# Altium project DT10965_MOTOR_CONTROLLER.PrjPcb (part 4 of 4)

## Sheet Power_management.SchDoc: =DT_SCH_Title
size A3; Organization: Droid Technologies; DocumentNumber: DT10965; Revision: 1.0
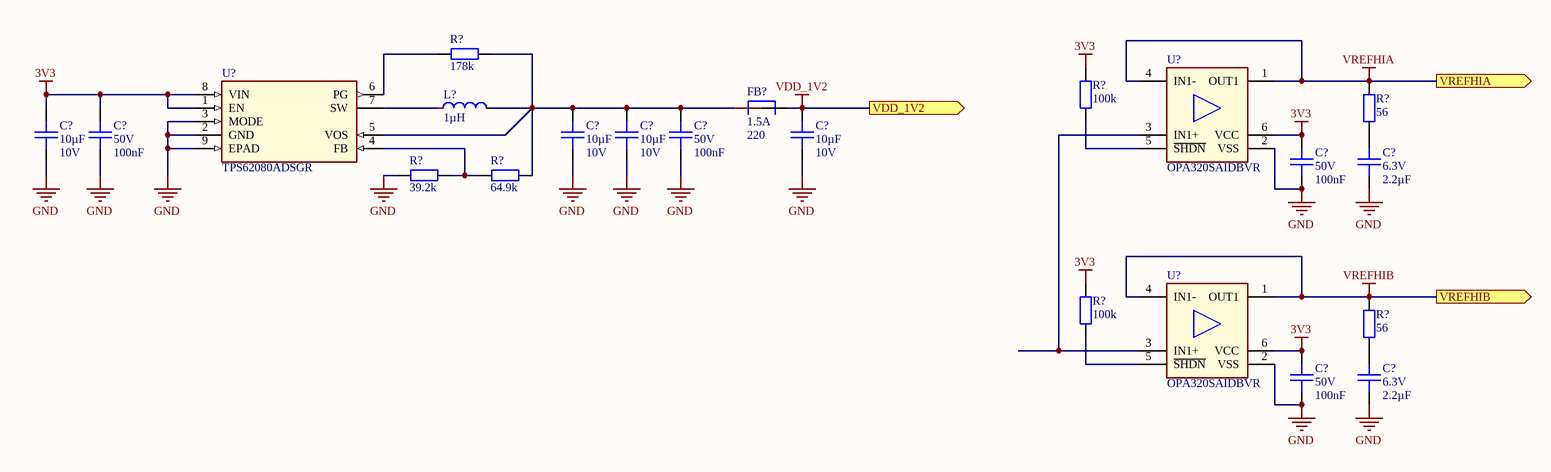
[diagram p12: Power_management.SchDoc]

### Parts
(Parts that share a designator on the sheet are numbered #1, #2 ... from top to bottom, then left to right.)
C?#156  Capacitance: 10µF  Voltage Rating: 10V  [CAPC200X125X145L50]  (hidden comment: CGA4J1X8L1A106K125AC)
C?#157  Voltage Rating: 50V  Capacitance: 100nF  [CAPC100x50x50L25]  (hidden comment: GCM155L8EH104KE07D)
C?#158  Capacitance: 10µF  Voltage Rating: 10V  [CAPC200X125X145L50]  (hidden comment: CGA4J1X8L1A106K125AC)
C?#159  Capacitance: 10µF  Voltage Rating: 10V  [CAPC200X125X145L50]  (hidden comment: CGA4J1X8L1A106K125AC)
C?#160  Voltage Rating: 50V  Capacitance: 100nF  [CAPC100x50x50L25]  (hidden comment: GCM155L8EH104KE07D)
C?#161  Capacitance: 10µF  Voltage Rating: 10V  [CAPC200X125X145L50]  (hidden comment: CGA4J1X8L1A106K125AC)
C?#162  Voltage Rating: 50V  Capacitance: 100nF  [CAPC100x50x50L25]  (hidden comment: GCM155L8EH104KE07D)
C?#163  Voltage Rating: 6.3V  Capacitance: 2.2µF  [CAPC160X80X90L35]  (hidden comment: C1608X8L0J225K080AC)
C?#164  Voltage Rating: 50V  Capacitance: 100nF  [CAPC100x50x50L25]  (hidden comment: GCM155L8EH104KE07D)
C?#165  Voltage Rating: 6.3V  Capacitance: 2.2µF  [CAPC160X80X90L35]  (hidden comment: C1608X8L0J225K080AC)
FB?#14  Imax: 1.5A  Impedance: 220  [BEADC160X80X95L40]  (hidden comment: BLM18KG221BH1D)
L?#2  Inductance: 1µH  [INDC250X200X120L60]  (hidden comment: DFE2HCAH1R0MJ0L)
R?#188  Resistance: 178k  [RESC100X50X40L25]  (hidden comment: RC0402FR-07178KL)
R?#189  Resistance: 100k  [RESC100X50X40L25]  (hidden comment: RC0402FR-07100KL)
R?#190  Resistance: 56  [RESC100X50X40L25]  (hidden comment: RC0402FR-0756RL)
R?#191  Resistance: 39.2k  [RESC100X50X40L25]  (hidden comment: RMCF0402FT39K2)
R?#192  Resistance: 64.9k  [RESC100X50X40L25]  (hidden comment: RC0402FR-0764K9L)
R?#193  Resistance: 100k  [RESC100X50X40L25]  (hidden comment: RC0402FR-07100KL)
R?#194  Resistance: 56  [RESC100X50X40L25]  (hidden comment: RC0402FR-0756RL)
U?#36  OPA320SAIDBVR  [SOT-23-6]
U?#37  TPS62080ADSGR  [WSON (8) 2*2mm]
U?#38  OPA320SAIDBVR  [SOT-23-6]

### Ports
VDD_1V2 (out), VREFHIA (out), VREFHIB (out)

### Nets
3V3: C?#156.2 C?#157.2 C?#162.2 C?#164.2 R?#189.2 R?#193.2 U?#36.6(VCC) U?#37.1(EN) U?#37.8(VIN) U?#38.6(VCC)
GND: C?#156.1 C?#157.1 C?#158.1 C?#159.1 C?#160.1 C?#161.1 C?#162.1 C?#163.1 C?#164.1 C?#165.1 R?#191.1 U?#36.2(VSS) U?#37.2(GND) U?#37.3(MODE) U?#37.9(EPAD) U?#38.2(VSS)
VDD_1V2: C?#161.2 FB?#14.2 ; port VDD_1V2
VREFHIA: R?#190.2 U?#36.1(OUT1) U?#36.4(IN1-) ; port VREFHIA
VREFHIB: R?#194.2 U?#38.1(OUT1) U?#38.4(IN1-) ; port VREFHIB
NetC?#158_2: C?#158.2 C?#159.2 C?#160.2 FB?#14.1 L?#2.2 R?#188.2 R?#192.2 U?#37.5(VOS)
NetC?#163_2: C?#163.2 R?#190.1
NetC?#165_2: C?#165.2 R?#194.1
NetL?#2_1: L?#2.1 U?#37.7(SW)
NetR?#188_1: R?#188.1 U?#37.6(PG)
NetR?#189_1: R?#189.1 U?#36.5(~{SHDN})
NetR?#191_2: R?#191.2 R?#192.1 U?#37.4(FB)
NetR?#193_1: R?#193.1 U?#38.5(~{SHDN})
NetU?#36_3: U?#36.3(IN1+) U?#38.3(IN1+)

### Notes on the sheet
- Title
- Size:
- A3
- Number:
- Revision:
- Date:
- Time:
- Sheet
- of

### Library data of the parts
C?#156 C?#158 C?#159 C?#161 = CMP-001-1984-1: CAP CER 10UF 10V X8L 0805; Manufacturer: TDK Corporation; Tolerance: 10%; Op Temp min: -55°C; Op Temp max: 150°C; ComponentLink3Description: Digikey; Mounting Type: SM; Ratings: AEC-Q200; ComponentLink1Description: Datasheet; ComponentLink3URL: https://www.digikey.com/en/products/detail/tdk-corporation/CGA4J1X8L1A106K125AC/9991388; Lead Spacing: 0mm; MPN: CGA4J1X8L1A106K125AC; Size: 2.00mm x 1.25mm; Height max: 1.5mm; ComponentLink2URL: https://eu.mouser.com/ProductDetail/TDK/CGA4J1X8L1A106K125AC?qs=gZXFycFWdANzH%252B2UvJJjtQ%3D%3D; Package: 0805 (2012 Metric); ComponentLink2Description: Mouser; Dielectric: X8L; ComponentLink1URL: https://product.tdk.com/system/files/dam/doc/product/capacitor/ceramic/mlcc/catalog/mlcc_automotive_hightemp_en.pdf
C?#157 C?#160 C?#162 C?#164 = CMP-001-1980-1: as C?#91-C?#94 on sheet Phase Current_Voltage Sense; Height max: 550µm; ComponentLink3Description: Digikey; Mounting Type: SM; ComponentLink3URL: https://www.digikey.com/en/products/detail/murata-electronics/GCM155L8EH104KE07D/11618823; Package: 0402 (1005 Metric); Lead Spacing: 0mm; MPN: GCM155L8EH104KE07D; Size: 1.00mm x 0.50mm; Ratings: AEC-Q200; ComponentLink1URL: https://search.murata.co.jp/Ceramy/image/img/A01X/G101/ENG/GCM155L8EH104KE07-01.pdf; ComponentLink1Description: Datasheet; Dielectric: X8L; ComponentLink2Description: Mouser; ComponentLink2URL: https://eu.mouser.com/ProductDetail/Murata-Electronics/GCM155L8EH104KE07D?qs=1mbolxNpo8fQSHf0HYnZWw%3D%3D
C?#163 C?#165 = CMP-001-2044-1: CAP CER 2.2UF 6.3V X8L 0603; Manufacturer: TDK Corporation; Op Temp min: -55°C; Tolerance: 10%; Op Temp max: 150°C; ComponentLink1URL: https://product.tdk.com/en/search/capacitor/ceramic/mlcc/info?part_no=C1608X8L0J225K080AC; MPN: C1608X8L0J225K080AC; ComponentLink3URL: https://www.digikey.com/en/products/detail/tdk-corporation/C1608X8L0J225K080AC/8343784; ComponentLink1Description: Datasheet; Lead Spacing: 0mm; ComponentLink3Description: Digikey; Package: 0603 (1608 Metric); Height max: 900µm; Size: 1.60mm x 0.80mm; Dielectric: X8L; Ratings: -; Mounting Type: SM; ComponentLink2URL: https://eu.mouser.com/ProductDetail/TDK/C1608X8L0J225K080AC?qs=rrS6PyfT74dgREMaiAoT3Q%3D%3D; ComponentLink2Description: Mouser
FB?#14 = CMP-001-1981-1: FERRITE BEAD 220 OHM 0603 1LN; Manufacturer: Murata Electronics; DCR: 50m; Op Temp min: -55°C; Frequency: 100MHz; Op Temp max: 150°C; Number of Lines: 1; Mounting Type: SM; Size: 1.60mm x 0.80mm; ComponentLink2URL: https://eu.mouser.com/ProductDetail/Murata-Electronics/BLM18KG221BH1D?qs=sJ5gq5MLFXpgEHYBdWUtkQ%3D%3D; ComponentLink1Description: Datasheet; ComponentLink1URL: https://www.murata.com/en-us/products/productdata/8798137286686/QNFA9129.pdf; Lead Spacing: 0mm; Ratings: AEC-Q200; ComponentLink3Description: Digikey; ComponentLink3URL: https://www.digikey.com/en/products/detail/murata-electronics/BLM18KG221BH1D/6156000; Height max: 950µm; Package: 0603 (1608 Metric); ComponentLink2Description: Mouser; MPN: BLM18KG221BH1D
L?#2 = CMP-001-2041-1: FIXED IND 1UH 3A 50 MOHM SMD; Manufacturer: Murata Electronics; Fsr: 79MHz; Shielding: Shielded; Material - Core: Metal; DCR: 50m; Type: Drum Core, Wirewound; Op Temp min: -40°C; Isat: 3.4A; Tolerance: 20%; Op Temp max: 150°C; Height max: 1.2mm; I: 3A; ComponentLink1URL: https://www.murata.com/en-us/products/productdetail?partno=DFE2HCAH1R0MJ0%23; ComponentLink1Description: Datasheet; Lead Spacing: 0mm; ComponentLink3URL: https://www.digikey.com/en/products/detail/murata-electronics/DFE2HCAH1R0MJ0L/10135180; ComponentLink2URL: https://eu.mouser.com/ProductDetail/Murata-Electronics/DFE2HCAH1R0MJ0L?qs=17u8i%2FzlE8%2FsfvqDr48AMQ%3D%3D; Ratings: AEC-Q200; ComponentLink3Description: Digikey; Package: 1008 (2520 Metric); ComponentLink2Description: Mouser; MPN: DFE2HCAH1R0MJ0L; Size: 2.50mm x 2.00mm; Mounting Type: SM
R?#188 = CMP-00630-3: RES 178K OHM 1% 1/16W 0402; Manufacturer: YAGEO; Temperature Coefficient: ±100ppm; Power: 63mW; Op Temp min: -55°C; Op Temp max: 155°C; Size: 1.00mm x 0.50mm; Composition: Thick Film; ComponentLink3URL: https://www.digikey.com/en/products/detail/yageo/RC0402FR-07178KL/5280870?s=N4IgTCBcDaIEoGEAMAWJYBicC0SDsAjHgBwDSAMiALoC%2BQA; Tolerance: 1%; Package: 0402 (1005 Metric); ComponentLink3Description: Digikey; ComponentLink1Description: Datasheet; MPN: RC0402FR-07178KL; Mounting Type: SM; Ratings: -; ComponentLink1URL: https://www.yageo.com/upload/media/product/productsearch/datasheet/rchip/PYu-RC_Group_51_RoHS_L_12.pdf; ComponentLink2URL: https://eu.mouser.com/ProductDetail/YAGEO/RC0402FR-07178KL?qs=UOUeRUa%252B8WmEoK18p4ojZQ%3D%3D; Height max: 400µm; ComponentLink2Description: Mouser
R?#189 R?#193 = CMP-00121-6: RES 100K OHM 1% 1/16W 0402; Manufacturer: YAGEO; Op Temp min: -55°C; Op Temp max: 155°C; Power: 63mW; Temperature Coefficient: ±100ppm; ComponentLink2Description: Mouser; Mounting Type: SM; Composition: Thick Film; ComponentLink3URL: https://www.digikey.com/en/products/detail/yageo/RC0402FR-07100KL/726526; Size: 1.00mm x 0.50mm; MPN: RC0402FR-07100KL; Tolerance: 1%; Ratings: -; ComponentLink1Description: Datasheet; ComponentLink2URL: https://eu.mouser.com/ProductDetail/YAGEO/RC0402FR-07100KL?qs=%2Fha2pyFaduhjtLcYvKXQ8IUndG0u%252BuCx1gxMxvN%252Btd7iB7mgHWsSbw%3D%3D; Package: 0402 (1005 Metric); ComponentLink1URL: https://www.yageo.com/upload/media/product/productsearch/datasheet/rchip/PYu-RC_Group_51_RoHS_L_12.pdf; ComponentLink3Description: Digikey; Height max: 400µm
R?#190 R?#194 = CMP-001-0492-6: RES 56 OHM 1% 1/16W 0402; Manufacturer: YAGEO; Op Temp min: -55°C; Temperature Coefficient: ±100ppm; Power: 63mW; Op Temp max: 155°C; Size: 1.00mm x 0.50mm; Mounting Type: SM; Height max: 400mm; ComponentLink3Description: Digikey; Tolerance: 1%; Ratings: -; MPN: RC0402FR-0756RL; ComponentLink1URL: https://www.yageo.com/upload/media/product/productsearch/datasheet/rchip/PYu-RC_Group_51_RoHS_L_12.pdf; ComponentLink3URL: https://www.digikey.com/en/products/detail/yageo/RC0402FR-0756RL/726636; ComponentLink2Description: Mouser; Composition: Thick Film; ComponentLink2URL: https://eu.mouser.com/ProductDetail/YAGEO/RC0402FR-0756RL?qs=V1yeUXFNrkmJal7VE1rFjw%3D%3D; ComponentLink1Description: Datasheet; Package: 0402 (1005 Metric)
R?#191 = CMP-001-2043-1: RES 39.2K OHM 1% 1/16W 0402; Manufacturer: Stackpole Electronics Inc; Op Temp min: -55°C; Temperature Coefficient: ±100ppm; Power: 63mW; Op Temp max: 155°C; ComponentLink1Description: Datasheet; Composition: Thick Film; ComponentLink1URL: https://www.seielect.com/catalog/sei-rmcf_rmcp.pdf; Package: 0402 (1005 Metric); ComponentLink3Description: Digikey; Tolerance: 1%; ComponentLink2Description: Mouser; MPN: RMCF0402FT39K2; Height max: 400µm; Ratings: AEC-Q200; ComponentLink2URL: https://eu.mouser.com/ProductDetail/SEI-Stackpole/RMCF0402FT39K2?qs=IPgv5n7u5QZ19xDSJPwVdQ%3D%3D; ComponentLink3URL: https://www.digikey.com/en/products/detail/stackpole-electronics-inc/RMCF0402FT39K2/1761390; Mounting Type: SM; Size: 1.00mm x 0.50mm
R?#192 = CMP-00721-2: RES 64.9K OHM 1% 1/16W 0402; Manufacturer: YAGEO; Temperature Coefficient: ±100ppm; Op Temp min: -55°C; Power: 63mW; Op Temp max: 155°C; Tolerance: 1%; Package: 0402 (1005 Metric); ComponentLink2URL: https://eu.mouser.com/ProductDetail/YAGEO/RC0402FR-0764K9L?qs=Is6ZsIPfHkbVUkOpst8WdA%3D%3D; MPN: RC0402FR-0764K9L; ComponentLink1URL: https://www.yageo.com/upload/media/product/productsearch/datasheet/rchip/PYu-RC_Group_51_RoHS_L_12.pdf; ComponentLink2Description: Mouser; ComponentLink3Description: Digikey; ComponentLink3URL: https://www.digikey.com/en/products/detail/yageo/RC0402FR-0764K9L/726649?s=N4IgTCBcDaIEoGEAMAWJYBicC0SDsAbCgNICcAMiALoC%2BQA; Composition: Thick Film; ComponentLink1Description: Datasheet; Mounting Type: SM; Ratings: -; Size: 1.00mm x 0.50mm; Height max: 400µm
U?#36 U?#38 = OPA320SAIDBVR: CMOS Amplifier 1 Circuit Rail-to-Rail SOT-23-6; Manufacturer: Texas Instruments; MPN: OPA320SAIDBVR
U?#37 = TPS62080ADSGR: IC REG BUCK ADJ 1.2A 8WSON; Manufacturer: Texas Instruments; MPN: TPS62080ADSGR

## Nets that join several sheets
3V3: MCU (8 pins), Flash_memory (FB?#4.1), EEPROM_memory (FB?#5.1), Temp_sensor (FB?#6.1), Accelerometers (FB?#7.1 FB?#8.2 FB?#9.2), Phase Current_Voltage Sense (14 pins), Calendar (FB?#12.1), Power_management (10 pins)
5V0: Phase Current_Voltage Sense (FB?#10.1), Pressure_sensor_AFE (FB?#11.1)
GND: MCU (38 pins), MCU_debug (8 pins), Flash_memory (23 pins), EEPROM_memory (5 pins), Temp_sensor (C?#55.1 C?#56.1 C?#57.1 U?#18.2), Accelerometers (18 pins), H-bridge (33 pins), Phase Current_Voltage Sense (36 pins), Resolver (29 pins), Pressure_sensor_AFE (14 pins), Calendar (C?#149.1 C?#150.1 U?#35.4), USB_interface (7 pins), Power_management (16 pins)
VBAT: H-bridge (21 pins), Phase Current_Voltage Sense (R?#117.2)
VDD_1V2: MCU (18 pins), Power_management (C?#161.2 FB?#14.2)
VPWR: MCU_debug (8 pins), Resolver (12 pins)
VREFHIA: MCU (U?#3.19), Power_management (R?#190.2 U?#36.1 U?#36.4)
VREFHIB: MCU (U?#3.37), Power_management (R?#194.2 U?#38.1 U?#38.4)
I2C_SCL: Accelerometers (R?#94.1), Calendar (R?#181.2)
I2C_SDA: Accelerometers (R?#95.1), Calendar (R?#182.2)
NetC?#70_1: H-bridge (9 pins), Phase Current_Voltage Sense (R?#115.1 R?#121.2)
NetC?#77_1: H-bridge (9 pins), Phase Current_Voltage Sense (R?#125.1 R?#130.2)
NetC?#84_1: H-bridge (9 pins), Phase Current_Voltage Sense (R?#135.1 R?#141.2)
P1OUT: MCU_debug (5 pins), Resolver (C?#111.1 R?#147.2 U?#32.13)
P2OUT: MCU_debug (5 pins), Resolver (C?#122.1 R?#154.2 U?#32.9)